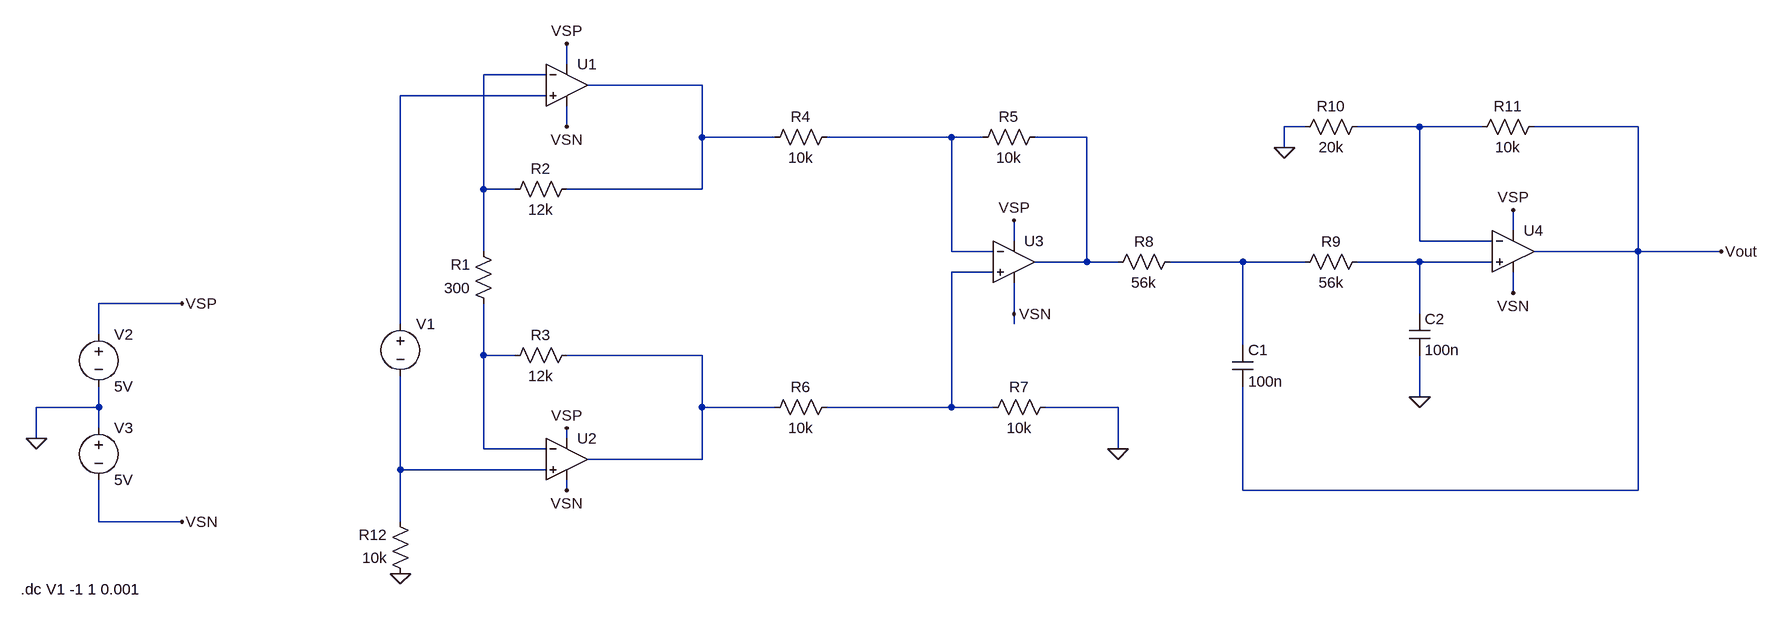
[diagram p0: schematic Ex 5.1.asc]
Ex 5.1.asc, the LTspice schematic file:
Version 4
SHEET 1 880 680
WIRE -3600 -3648 -3600 -3680
WIRE -3632 -3632 -3728 -3632
WIRE -3392 -3616 -3568 -3616
WIRE -3632 -3600 -3856 -3600
WIRE -3600 -3552 -3600 -3584
WIRE -2464 -3552 -2496 -3552
WIRE -2288 -3552 -2384 -3552
WIRE -2192 -3552 -2288 -3552
WIRE -1952 -3552 -2112 -3552
WIRE -3392 -3536 -3392 -3616
WIRE -3280 -3536 -3392 -3536
WIRE -3008 -3536 -3200 -3536
WIRE -2960 -3536 -3008 -3536
WIRE -2800 -3536 -2880 -3536
WIRE -2496 -3520 -2496 -3552
WIRE -3728 -3456 -3728 -3632
WIRE -3680 -3456 -3728 -3456
WIRE -3392 -3456 -3392 -3536
WIRE -3392 -3456 -3600 -3456
WIRE -2144 -3392 -2144 -3424
WIRE -2912 -3376 -2912 -3408
WIRE -2288 -3376 -2288 -3552
WIRE -2176 -3376 -2288 -3376
WIRE -3728 -3360 -3728 -3456
WIRE -3008 -3360 -3008 -3536
WIRE -2944 -3360 -3008 -3360
WIRE -1952 -3360 -1952 -3552
WIRE -1952 -3360 -2112 -3360
WIRE -1824 -3360 -1952 -3360
WIRE -2800 -3344 -2800 -3536
WIRE -2800 -3344 -2880 -3344
WIRE -2752 -3344 -2800 -3344
WIRE -2560 -3344 -2672 -3344
WIRE -2464 -3344 -2560 -3344
WIRE -2288 -3344 -2384 -3344
WIRE -2176 -3344 -2288 -3344
WIRE -2944 -3328 -3008 -3328
WIRE -2144 -3296 -2144 -3328
WIRE -4192 -3280 -4320 -3280
WIRE -2912 -3264 -2912 -3312
WIRE -2288 -3264 -2288 -3344
WIRE -3856 -3248 -3856 -3600
WIRE -2912 -3248 -2912 -3264
WIRE -4320 -3232 -4320 -3280
WIRE -2560 -3216 -2560 -3344
WIRE -3728 -3200 -3728 -3280
WIRE -3680 -3200 -3728 -3200
WIRE -3392 -3200 -3600 -3200
WIRE -2288 -3136 -2288 -3200
WIRE -4320 -3120 -4320 -3152
WIRE -4320 -3120 -4416 -3120
WIRE -3392 -3120 -3392 -3200
WIRE -3280 -3120 -3392 -3120
WIRE -3008 -3120 -3008 -3328
WIRE -3008 -3120 -3200 -3120
WIRE -2944 -3120 -3008 -3120
WIRE -2752 -3120 -2864 -3120
WIRE -4320 -3088 -4320 -3120
WIRE -4416 -3072 -4416 -3120
WIRE -3600 -3072 -3600 -3088
WIRE -3728 -3056 -3728 -3200
WIRE -3632 -3056 -3728 -3056
WIRE -2752 -3056 -2752 -3120
WIRE -3392 -3040 -3392 -3120
WIRE -3392 -3040 -3568 -3040
WIRE -3856 -3024 -3856 -3168
WIRE -3632 -3024 -3856 -3024
WIRE -3600 -2992 -3600 -3008
WIRE -2560 -2992 -2560 -3152
WIRE -1952 -2992 -1952 -3360
WIRE -1952 -2992 -2560 -2992
WIRE -4320 -2944 -4320 -3008
WIRE -4192 -2944 -4320 -2944
WIRE -3856 -2944 -3856 -3024
FLAG -4416 -3072 0
FLAG -4192 -3280 VSP
FLAG -4192 -2944 VSN
FLAG -3856 -2864 0
FLAG -2752 -3056 0
FLAG -2496 -3520 0
FLAG -2288 -3136 0
FLAG -2144 -3424 VSP
FLAG -2912 -3408 VSP
FLAG -3600 -3088 VSP
FLAG -3600 -3680 VSP
FLAG -3600 -3552 VSN
FLAG -3600 -2992 VSN
FLAG -2912 -3264 VSN
FLAG -2144 -3296 VSN
FLAG -1824 -3360 Vout
SYMBOL voltage -4320 -3248 R0
WINDOW 123 0 0 Left 0
WINDOW 39 0 0 Left 0
SYMATTR InstName V2
SYMATTR Value 5V
SYMBOL voltage -4320 -3104 R0
SYMATTR InstName V3
SYMATTR Value 5V
SYMBOL voltage -3856 -3264 R0
WINDOW 3 24 44 Left 2
WINDOW 123 24 72 Left 2
WINDOW 39 0 0 Left 0
SYMATTR Value ""
SYMATTR InstName V1
SYMBOL res -3712 -3264 R180
WINDOW 0 36 76 Left 2
WINDOW 3 36 40 Left 2
SYMATTR InstName R1
SYMATTR Value 300
SYMBOL OpAmps\\UniversalOpAmp2 -3600 -3616 R0
SYMATTR InstName U1
SYMBOL OpAmps\\UniversalOpAmp2 -3600 -3040 R0
SYMATTR InstName U2
SYMBOL OpAmps\\UniversalOpAmp2 -2912 -3344 R0
SYMATTR InstName U3
SYMBOL OpAmps\\UniversalOpAmp2 -2144 -3360 R0
SYMATTR InstName U4
SYMBOL res -3584 -3472 R90
WINDOW 0 0 56 VBottom 2
WINDOW 3 32 56 VTop 2
SYMATTR InstName R2
SYMATTR Value 12k
SYMBOL res -3584 -3216 R90
WINDOW 0 0 56 VBottom 2
WINDOW 3 32 56 VTop 2
SYMATTR InstName R3
SYMATTR Value 12k
SYMBOL res -3184 -3552 R90
WINDOW 0 0 56 VBottom 2
WINDOW 3 32 56 VTop 2
SYMATTR InstName R4
SYMATTR Value 10k
SYMBOL res -2864 -3552 R90
WINDOW 0 0 56 VBottom 2
WINDOW 3 32 56 VTop 2
SYMATTR InstName R5
SYMATTR Value 10k
SYMBOL res -3184 -3136 R90
WINDOW 0 0 56 VBottom 2
WINDOW 3 32 56 VTop 2
SYMATTR InstName R6
SYMATTR Value 10k
SYMBOL res -2848 -3136 R90
WINDOW 0 0 56 VBottom 2
WINDOW 3 32 56 VTop 2
SYMATTR InstName R7
SYMATTR Value 10k
SYMBOL res -2656 -3360 R90
WINDOW 0 0 56 VBottom 2
WINDOW 3 32 56 VTop 2
SYMATTR InstName R8
SYMATTR Value 56k
SYMBOL res -2368 -3360 R90
WINDOW 0 0 56 VBottom 2
WINDOW 3 32 56 VTop 2
SYMATTR InstName R9
SYMATTR Value 56k
SYMBOL res -2368 -3568 R90
WINDOW 0 0 56 VBottom 2
WINDOW 3 32 56 VTop 2
SYMATTR InstName R10
SYMATTR Value 20k
SYMBOL res -2096 -3568 R90
WINDOW 0 0 56 VBottom 2
WINDOW 3 32 56 VTop 2
SYMATTR InstName R11
SYMATTR Value 10k
SYMBOL res -3840 -2848 R180
WINDOW 0 36 76 Left 2
WINDOW 3 36 40 Left 2
SYMATTR InstName R12
SYMATTR Value 10k
SYMBOL cap -2576 -3216 R0
SYMATTR InstName C1
SYMATTR Value 100n
SYMBOL cap -2304 -3264 R0
SYMATTR InstName C2
SYMATTR Value 100n
TEXT -4440 -2840 Left 2 !.dc V1 -1 1 0.001

The netlist it stands for:
* Ex 5.1.asc
V2 VSP 0 5V
V3 0 VSN 5V
V1 N003 N012
R1 N010 N001 300
XU1 N003 N001 VSP VSN N002 level2 Avol=1Meg GBW=10Meg Slew=10Meg Ilimit=25m Rail=0 Vos=0 En=0 Enk=0 In=0 Ink=0 Rin=500Meg  ; pins In+ In- V+ V- OUT
XU2 N012 N010 VSP VSN N011 level2 Avol=1Meg GBW=10Meg Slew=10Meg Ilimit=25m Rail=0 Vos=0 En=0 Enk=0 In=0 Ink=0 Rin=500Meg  ; pins In+ In- V+ V- OUT
XU3 N009 N005 VSP VSN N006 level2 Avol=1Meg GBW=10Meg Slew=10Meg Ilimit=25m Rail=0 Vos=0 En=0 Enk=0 In=0 Ink=0 Rin=500Meg  ; pins In+ In- V+ V- OUT
XU4 N008 N004 VSP VSN Vout level2 Avol=1Meg GBW=10Meg Slew=10Meg Ilimit=25m Rail=0 Vos=0 En=0 Enk=0 In=0 Ink=0 Rin=500Meg  ; pins In+ In- V+ V- OUT
R2 N002 N001 12k
R3 N011 N010 12k
R4 N005 N002 10k
R5 N006 N005 10k
R6 N009 N011 10k
R7 0 N009 10k
R8 N007 N006 56k
R9 N008 N007 56k
R10 N004 0 20k
R11 Vout N004 10k
R12 0 N012 10k
C1 N007 Vout 100n
C2 N008 0 100n
.dc V1 -1 1 0.001
.lib UniversalOpAmp2.lib
.backanno
.end